# Altium schematic sheet E2PROM.SchDoc
size 300 x 200 mm; SheetNumber: 7; SheetTotal: 11
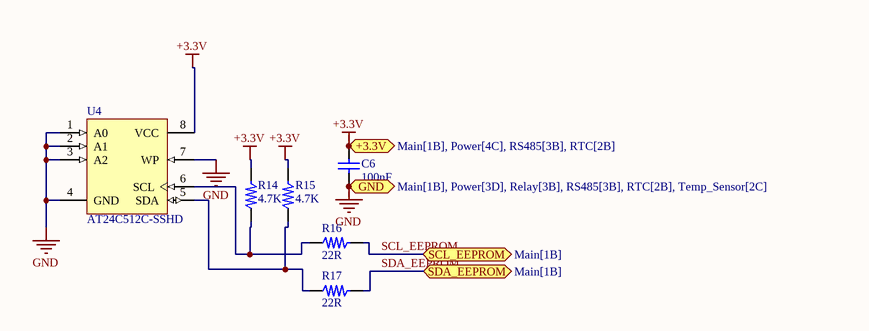
[diagram p0: E2PROM.SchDoc]

## Parts
C6  100nF  [C0805]
R14  4.7K  [R0805]
R15  4.7K  [R0805]
R16  22R  [R0805]
R17  22R  [R0805]
U4  AT24C512C-SSHD  [8S1_N]

## Ports
+3.3V (bidir, see Main[1B], Power[4C], RS485[3B], RTC[2B]), GND (bidir, see Main[1B], Power[3D], Relay[3B], RS485[3B], RTC[2B], Temp_Sensor[2C]), SCL_EEPROM (bidir, see Main[1B]), SDA_EEPROM (bidir, see Main[1B])

## Nets
+3.3V: C6.2 R14.2 R15.2 U4.8(VCC) ; port +3.3V
GND: C6.1 U4.1(A0) U4.2(A1) U4.3(A2) U4.4(GND) U4.7(WP) ; port GND
SCL_EEPROM: R16.2 ; port SCL_EEPROM
SDA_EEPROM: R17.2 ; port SDA_EEPROM
NetR14_1: R14.1 R16.1 U4.6(SCL)
NetR15_1: R15.1 R17.1 U4.5(SDA)

## Library data of the parts
C6 = 2-Cap: Bipolar Capacitor; Type: MKT
R14-R17 = myRes_1
  R14 R15: Value: 4.7K
  R16 R17: Value: 22R
U4 = AT24C01BN-SP25-B: 1Kbit (128 x 8), 2-wire Bus Automotive Serial EEPROM with Write Protect, 2.5V, 8-Pin SOIC, Bulk; Published: 20-Sep-2010; DatasheetVersion: 8517C,  Jan-2009; PackageVersion: revC, Mar-2005; PackageReference: 8S1; Publisher: Altium Limited; PackageDescription: 8-Lead (0.150" Wide Body), Plastic Gull Wing Small Outline (JEDEC SOIC); Code_JEDEC: MS-012-AA; Code_IPC: SOIC127P600-8; ComponentLink1Description: Manufacturer Link; ComponentLink1URL: http://www.atmel.com/products/serial/default.asp; ComponentLink2Description: Datasheet; ComponentLink2URL: http://www.atmel.com/dyn/resources/prod_documents/doc8517.pdf; ComponentLink3Description: Atmel.com Home; ComponentLink3URL: http://www.atmel.com